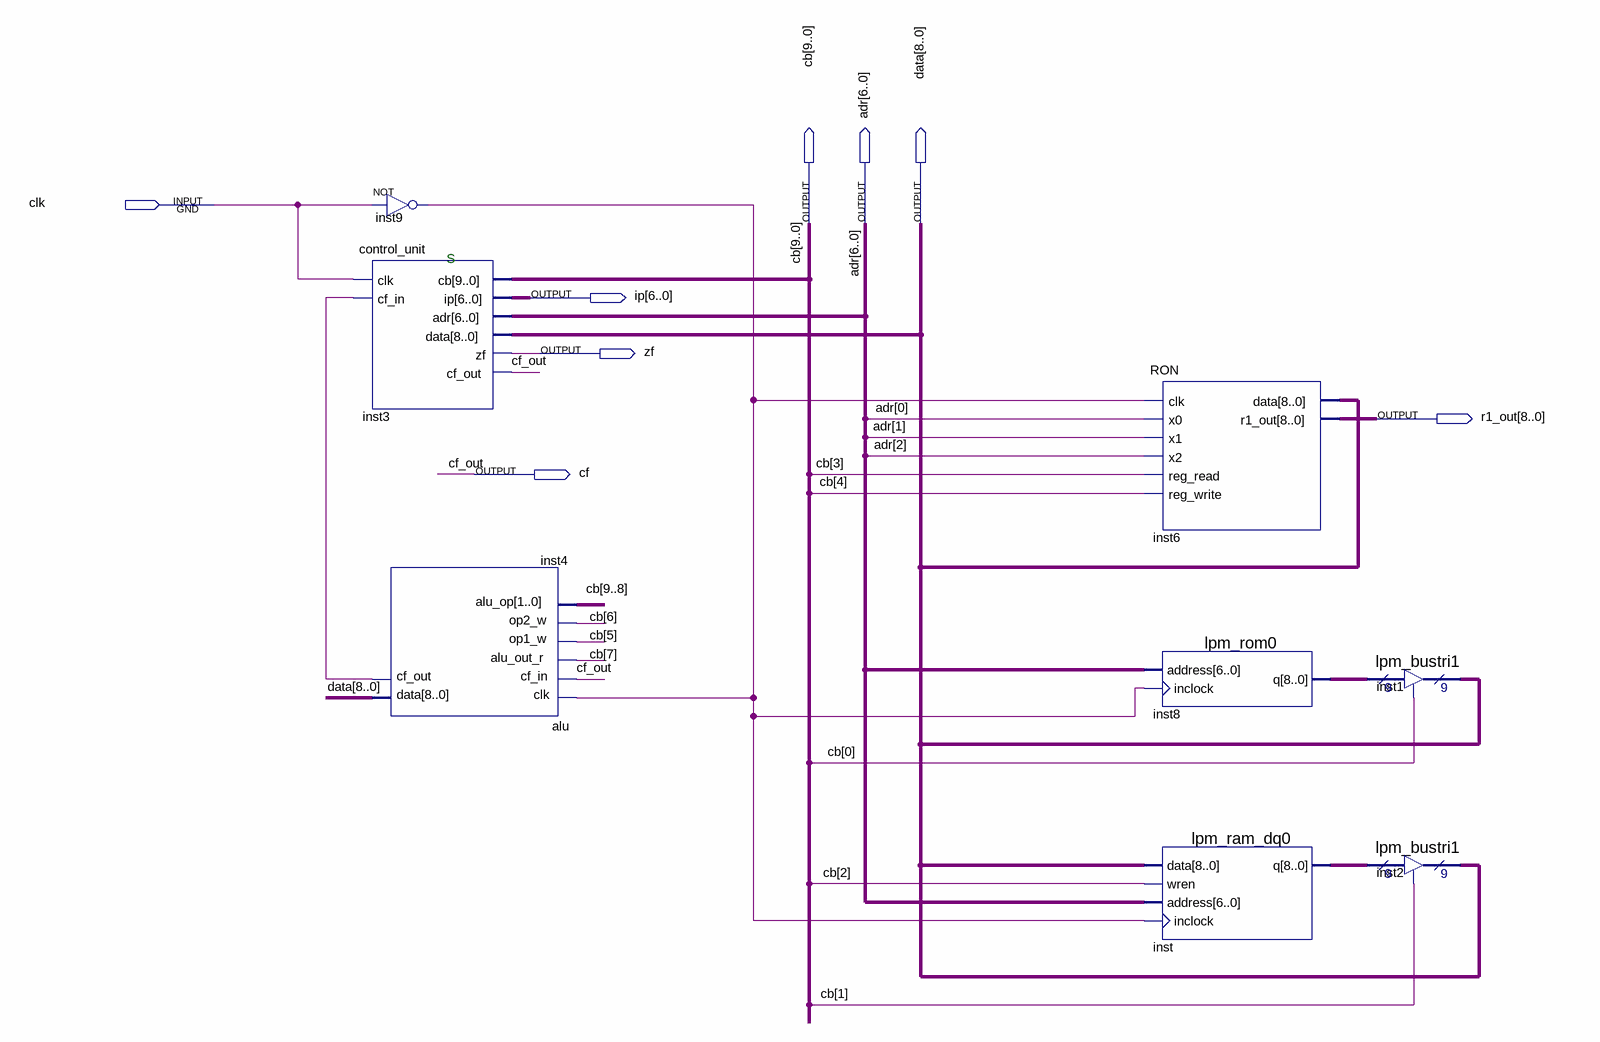
[diagram p0: schematic sheet]
// Quartus schematic lab5.bdf as structural Verilog: 8 symbols, 8 pins
module lab5 (
  input  clk,
  output [9:0] cb,
  output [6:0] adr,
  output [8:0] data,
  output [6:0] ip,
  output zf,
  output [8:0] r1_out,
  output cf
);

  wire inst4_cf_out, inst9_out;
  wire [8:0] inst8_q, inst_q;

  not inst9 (inst9_out, clk);
  control_unit inst3 (.clk(clk), .cf_in(inst4_cf_out), .cb(cb), .ip(ip), .adr(adr), .zf(zf), .cf_out(cf), .data(data));
  alu inst4 (
    .clk(inst9_out), .cf_in(cf), .alu_out_r(cb[7]), .op1_w(cb[5]), .op2_w(cb[6]), .alu_op(cb[9:8]),
    .cf_out(inst4_cf_out), .data(data));
  RON inst6 (
    .clk(inst9_out), .x0(adr[0]), .x1(adr[1]), .x2(adr[2]), .reg_read(cb[3]), .reg_write(cb[4]),
    .r1_out(r1_out), .data(data));
  lpm_rom0 inst8 (.address(adr), .inclock(inst9_out), .q(inst8_q));
  lpm_ram_dq0 inst (.data(data), .wren(cb[2]), .address(adr), .inclock(inst9_out), .q(inst_q));
  lpm_bustri1 inst1 (.enabledt(cb[0]), .data(inst8_q), .tridata(data));
  lpm_bustri1 inst2 (.enabledt(cb[1]), .data(inst_q), .tridata(data));

  // Other names for the same wires on the sheet: cf_out = cf

  // Notes on the sheet:
  //   S
endmodule
